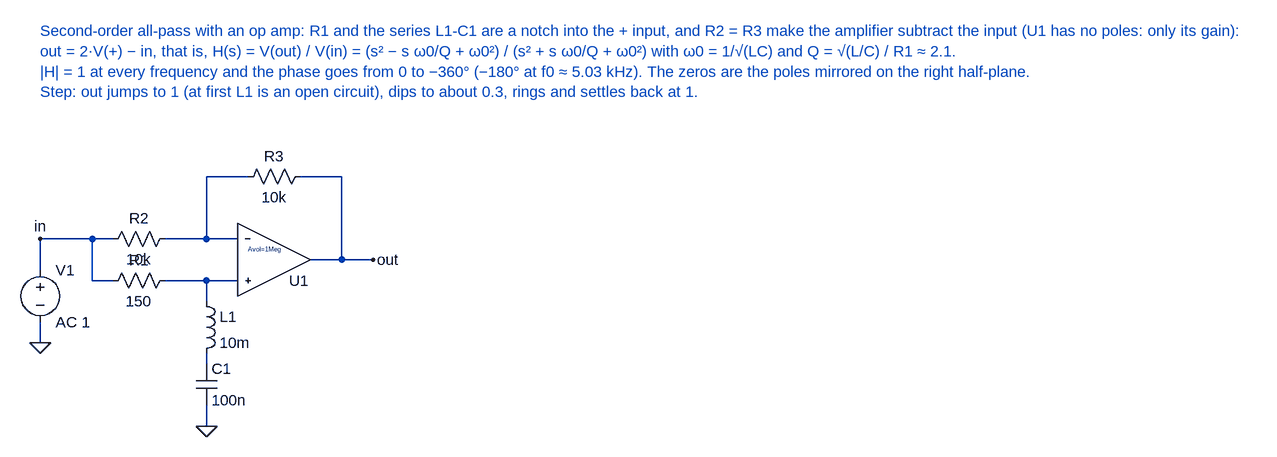
[diagram p0: schematic ap2.asc]
ap2.asc, the LTspice schematic file:
Version 4
SHEET 1 1200 800
WIRE 0 16 0 -32
WIRE 0 96 0 128
WIRE 0 -32 80 -32
WIRE 80 -32 112 -32
WIRE 192 -32 256 -32
WIRE 304 -32 256 -32
WIRE 256 -32 256 -128
WIRE 320 -128 256 -128
WIRE 400 -128 464 -128
WIRE 464 -128 464 0
WIRE 416 0 464 0
WIRE 464 0 512 0
WIRE 80 -32 80 32
WIRE 112 32 80 32
WIRE 192 32 256 32
WIRE 256 32 304 32
WIRE 256 32 256 64
WIRE 256 144 256 160
WIRE 256 224 256 256
FLAG 0 128 0
FLAG 0 -32 in
FLAG 512 0 out
FLAG 256 256 0
SYMBOL voltage 0 0 R0
SYMATTR InstName V1
SYMATTR Value AC 1
SYMBOL res 208 -48 R90
WINDOW 0 0 56 VBottom 2
WINDOW 3 32 56 VTop 2
SYMATTR InstName R2
SYMATTR Value 10k
SYMBOL res 416 -144 R90
WINDOW 0 0 56 VBottom 2
WINDOW 3 32 56 VTop 2
SYMATTR InstName R3
SYMATTR Value 10k
SYMBOL OA_NoPole 496 -48 R0
SYMATTR InstName U1
SYMBOL res 208 16 R90
WINDOW 0 0 56 VBottom 2
WINDOW 3 32 56 VTop 2
SYMATTR InstName R1
SYMATTR Value 150
SYMBOL ind 240 48 R0
SYMATTR InstName L1
SYMATTR Value 10m
SYMATTR SpiceLine Rser=0
SYMBOL cap 240 160 R0
SYMATTR InstName C1
SYMATTR Value 100n
TEXT 0 -352 Left 2 ;Second-order all-pass with an op amp: R1 and the series L1-C1 are a notch into the + input, and R2 = R3 make the amplifier subtract the input (U1 has no poles: only its gain):\nout = 2·V(+) − in, that is, H(s) = V(out) / V(in) = (s² − s ω0/Q + ω0²) / (s² + s ω0/Q + ω0²) with ω0 = 1/√(LC) and Q = √(L/C) / R1 ≈ 2.1.\n|H| = 1 at every frequency and the phase goes from 0 to −360° (−180° at f0 ≈ 5.03 kHz). The zeros are the poles mirrored on the right half-plane.\nStep: out jumps to 1 (at first L1 is an open circuit), dips to about 0.3, rings and settles back at 1.

The netlist it stands for:
* ap2.asc
V1 in 0 AC 1
R2 N001 in 10k
R3 out N001 10k
XU1 N002 N001 out OA_NoPole Avol=1Meg  ; pins In+ In- OUT
R1 N002 in 150
L1 N002 N003 10m Rser=0
C1 N003 0 100n
* Second-order all-pass with an op amp: R1 and the series L1-C1 are a notch into the + input, and R2 = R3 make the amplifier subtract the input (U1 has no poles: only its gain):
* out = 2·V(+) − in, that is, H(s) = V(out) / V(in) = (s² − s ω0/Q + ω0²) / (s² + s ω0/Q + ω0²) with ω0 = 1/√(LC) and Q = √(L/C) / R1 ≈ 2.1.
* |H| = 1 at every frequency and the phase goes from 0 to −360° (−180° at f0 ≈ 5.03 kHz). The zeros are the poles mirrored on the right half-plane.
* Step: out jumps to 1 (at first L1 is an open circuit), dips to about 0.3, rings and settles back at 1.
.lib OA_NoPole.sub
.backanno
.end